# Altium schematic sheet Power_IO.SchDoc
size A4; SheetNumber: 1; SheetTotal: 4
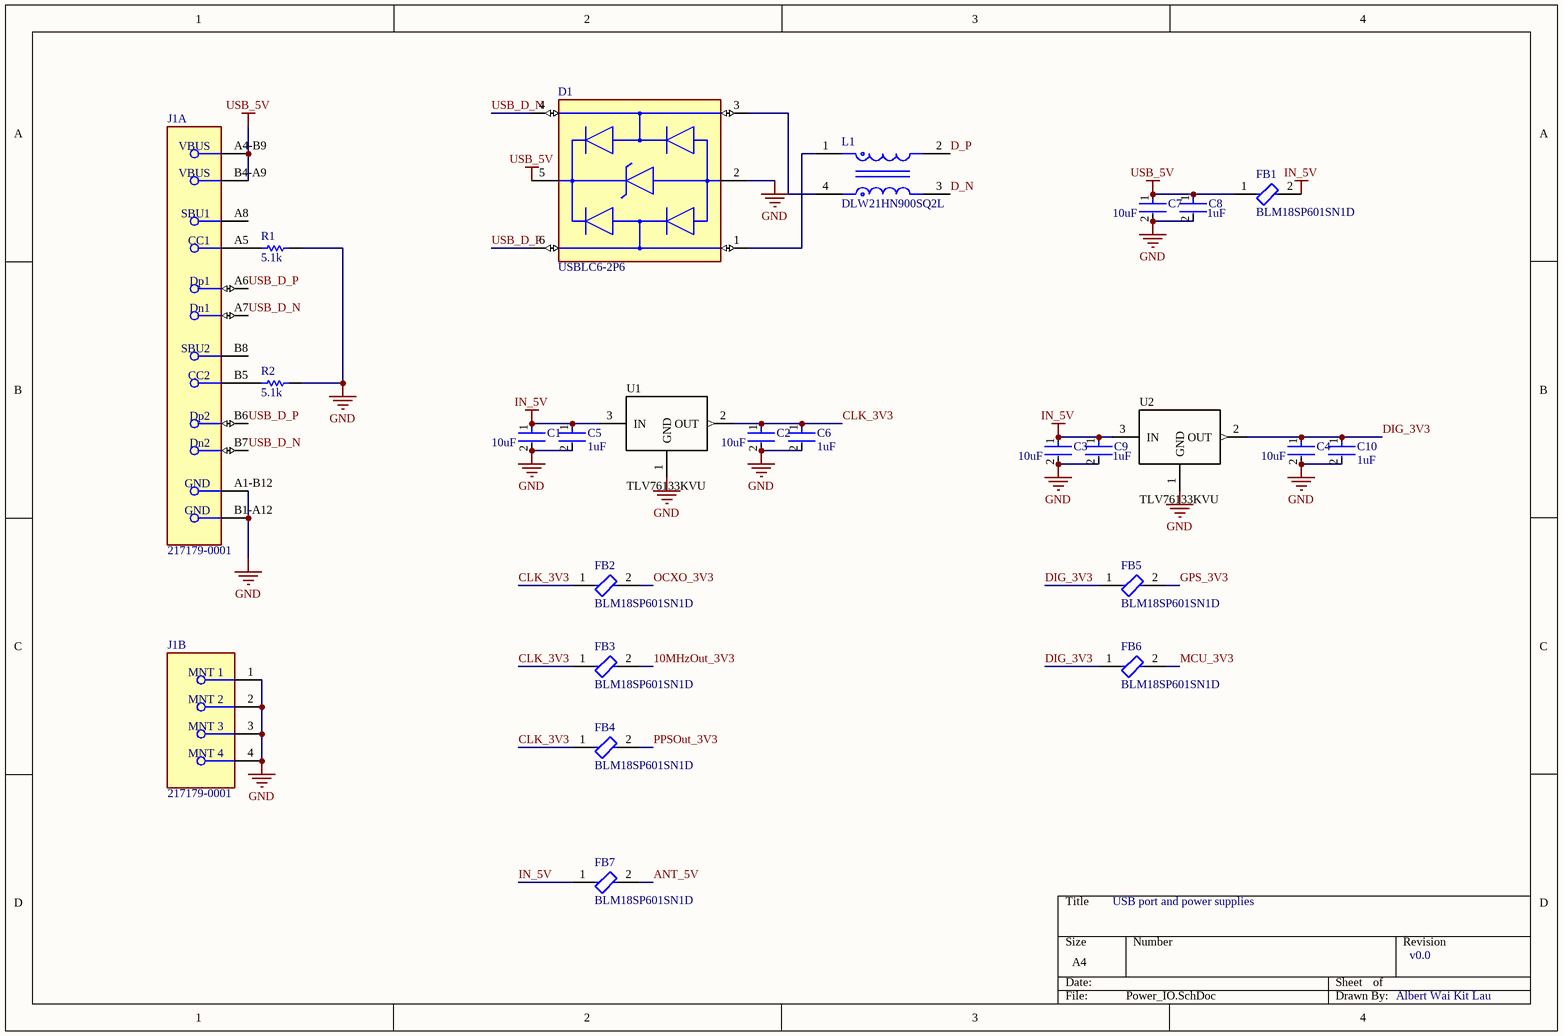
[diagram p0: Power_IO.SchDoc]

## Parts
C1  10uF  [FP-GRM21B-0_2-e0_2_0_7-IPC_A]
C2  10uF  [FP-GRM21B-0_2-e0_2_0_7-IPC_A]
C3  10uF  [FP-GRM21B-0_2-e0_2_0_7-IPC_A]
C4  10uF  [FP-GRM21B-0_2-e0_2_0_7-IPC_A]
C5  1uF  [FP-CL21-IPC_C]
C6  1uF  [FP-CL21-IPC_C]
C7  10uF  [FP-GRM21B-0_2-e0_2_0_7-IPC_A]
C8  1uF  [FP-CL21-IPC_C]
C9  1uF  [FP-CL21-IPC_C]
C10  1uF  [FP-CL21-IPC_C]
D1  USBLC6-2P6  [FP-SOT-666-MFG]
FB1  BLM18SP601SN1D  [FP-BLM18-0_15-t0_8-MFG]
FB2  BLM18SP601SN1D  [FP-BLM18-0_15-t0_8-MFG]
FB3  BLM18SP601SN1D  [FP-BLM18-0_15-t0_8-MFG]
FB4  BLM18SP601SN1D  [FP-BLM18-0_15-t0_8-MFG]
FB5  BLM18SP601SN1D  [FP-BLM18-0_15-t0_8-MFG]
FB6  BLM18SP601SN1D  [FP-BLM18-0_15-t0_8-MFG]
FB7  BLM18SP601SN1D  [FP-BLM18-0_15-t0_8-MFG]
J1  217179-0001  [FP-2171790001-MFG]  (parts A,B of 2)
L1  DLW21HN900SQ2L  [FP-DLW21HN-MFG]
R1  5.1k  [RESC1005X40X25LL10T10]
R2  5.1k  [RESC1005X40X25LL10T10]
U1  TLV76133KVU  [TO-252-3_KVU_TI_TabPin2]
U2  TLV76133KVU  [TO-252-3_KVU_TI_TabPin2]

## Nets
GND: C1.2 C2.2 C3.2 C4.2 C5.2 C6.2 C7.2 C8.2 C9.2 C10.2 D1.2(GND) J1.1(MNT_1) J1.2(MNT_2) J1.3(MNT_3) J1.4(MNT_4) J1.A1-B12(GND) J1.B1-A12(GND) R1.2 R2.2 U1.1(GND) U2.1(GND)
IN_5V: C1.1 C3.1 C5.1 C9.1 FB1.2 FB7.1 U1.3(IN) U2.3(IN)
USB_5V: C7.1 C8.1 D1.5(VBUS) FB1.1 J1.A4-B9(VBUS) J1.B4-A9(VBUS)
10MHzOut_3V3: FB3.2
ANT_5V: FB7.2
CLK_3V3: C2.1 C6.1 FB2.1 FB3.1 FB4.1 U1.2(OUT)
D_N: L1.3
D_P: L1.2
DIG_3V3: C4.1 C10.1 FB5.1 FB6.1 U2.2(OUT)
GPS_3V3: FB5.2
MCU_3V3: FB6.2
OCXO_3V3: FB2.2
PPSOut_3V3: FB4.2
USB_D_N: D1.4(I/O2) J1.A7(Dn1) J1.B7(Dn2)
USB_D_P: D1.6(I/O1) J1.A6(Dp1) J1.B6(Dp2)
NetD1_1: D1.1(I/O1) L1.1
NetD1_3: D1.3(I/O2) L1.4
NetJ1_A5: J1.A5(CC1) R1.1
NetJ1_B5: J1.B5(CC2) R2.1

Not connected (* = marked no-connect by the designer): J1 A8(SBU1) B8(SBU2)

## Notes on the sheet
- USB port and power supplies
- v0.0
- Albert Wai Kit Lau

## Library data of the parts
C1-C4 C7 = CMP-06035-004402-1: Chip Multilayer Ceramic Capacitors for General Purpose, 0805, 10uF, X5R, 15%, 10%, 50V; Voltage Rating (DC): 50V; Dielectric: X5R; Tolerance: 10%; Capacitance: 10uF; Thickness: 1.25mm; Length: 2mm; Width: 1.25mm; JLCPCB: C440198
C5 C6 C8-C10 = CMP-13271-004196-1: CL21 Series 0805 1uF 50V ±10% Tolerance X7R Multilayer Ceramic Chip Capacitor; Tolerance: 10%; Thickness: 0.053inch; Case/Package: 0805; Mount: Surface Mount; Depth: 1.25mm; Radiation Hardening: No; Voltage Rating: 50V; Max Operating Temperature: 125°C; Case Code (Imperial): 0805; Min Operating Temperature: -55°C; Length: 0.079inch; Dielectric: X7R; Case Code (Metric): 2012; Packaging: Tape and Reel; Width: 0.049inch; Package Quantity: 1; Capacitance: 1uF; Height: 1.25mm; JLCPCB: C28323
D1 = CMP-12225-000058-1: TVS DIODE 5.25V 17V SOT666; Min Breakdown Voltage: 6V; Power Line Protection: Yes; Element Configuration: Dual; Test Current: 1mA; Working Voltage: 5V; Number of Channels: 2; Max Reverse Leakage Current: 150nA; Direction: Unidirectional; Peak Pulse Current: 5A; Number of Elements: 1; Capacitance: 3.5pF; Max Breakdown Voltage: 6V; Height: 0.6mm; Depth: 1.3mm; Contact Plating: Tin; Reverse Breakdown Voltage: 6V; REACH SVHC: No SVHC; Operating Supply Voltage: 5V; Width: 1.3mm; Max Operating Temperature: 125°C; Reverse Standoff Voltage: 5V; ESD Protection: Yes; Package Quantity: 1; Termination: SMD/SMT; Length: 1.7mm; Leakage Current: 150nA; Number of Bidirectional Channels: 2; Case/Package: SOT-666; Min Operating Temperature: -40°C; Number of Pins: 6; Clamping Voltage: 17V; Breakdown Voltage: 6V; Lead Free: Lead Free; Radiation Hardening: No; Packaging: Tape and Reel; Mount: Surface Mount; Polarity: Unidirectional; JLCPCB: C15999
FB1-FB7 = CMP-00260-111572297-1: BLM18SP601SN1D Ferrite Bead, 600 Ohm, 1.5A, 0603 Rohs Compliant: Yes; Resistance: 140mΩ; Test Frequency: 100MHz; Tolerance: 25%; Height: 950µm; Min Operating Temperature: -55°C; NexarPartId: 111572297; Core Material: Ferrite; Max Operating Temperature: 125°C; Case/Package: 0603; Lifecycle Status: Production; Series Resistance: 140mΩ; RMS Current (Irms): 1.5A; JLCPCB: C3716583
J1 = CMP-04767-000028-2: CONN RCP USB2.0 TYP C 16P SMD RA; NexarPartId: 117190526; Gender: Receptacle; Number of Contacts: 16; Current Rating: 1.25A; Voltage Rating: 30V; Min Operating Temperature: -40°C; USB Standard: USB 2.0; Height: 3.36mm; Contact Material: Gold, Nickel; Max Operating Temperature: 85°C; JLCPCB: C3197684
L1 = CMP-06045-000050-1: CMC 330MA 2LN 90 OHM SMD; Tolerance: 25%; Frequency: 100MHz; Shielding: Unshielded; Impedance: 90R; Number of Lines: 2; DC Resistance (DCR): 350mR; Voltage Rating: 50V; DC Current: 330mA; Current Rating: 330mA; Lead Free: Lead Free; Length: 2mm; Radiation Hardening: No; Max Operating Temperature: 85°C; Depth: 1.2mm; Weight: 0.000317oz; Height: 0.9mm; Termination: SMD/SMT; Min Operating Temperature: -40°C; Case/Package: 0805; Packaging: Tape and Reel; Width: 0.047inch; Test Frequency: 100MHz; Mount: Surface Mount; Current: 330mA; Military Standard: Not; Package Quantity: 1; Resistor Type: Wirewound; Case Code (Imperial): 0805; Max DC Current: 330mA; JLCPCB: C80529
R1 R2 = CMP-2002-05746-1: Manufacturer: TE Connectivity / AMP; Part Number: CRG0402F5K1; JLCPCB: C25905
U1 U2 = TLV76133KVU: 18 V, 1 A fixed 3.3 V LDO regulator; TI KVU (TO-252); Manufacturer: Texas Instruments; Manufacturer Part Number: TLV76133KVUR; Output Voltage: 3.3 V; Output Current: 1 A; Package: KVU (TO-252-3); Datasheet: https://www.ti.com/lit/gpn/TLV761; JLCPCB: C41835077